# Altium schematic sheet auto_junctions.SchDoc
size 254 x 203 mm
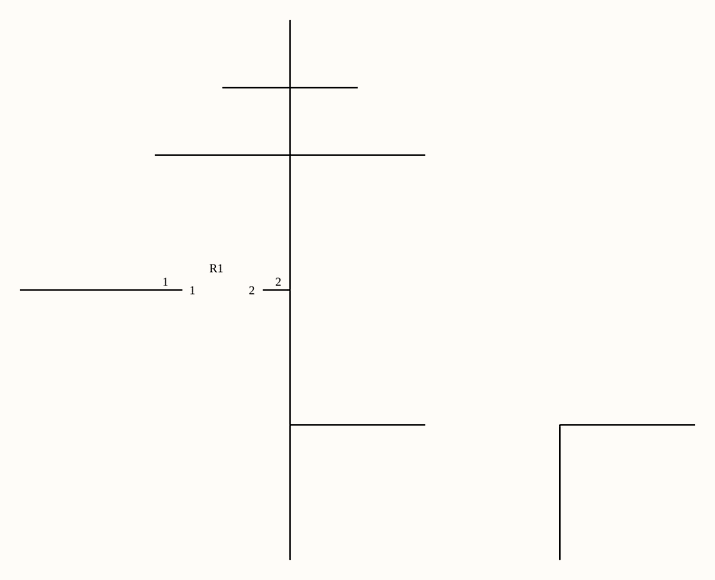
[diagram p0: auto_junctions.SchDoc]

## Parts
R1  (no value)

## Nets

Not connected (* = marked no-connect by the designer): R1 1 2

## Library data of the parts
R1 = Resistor